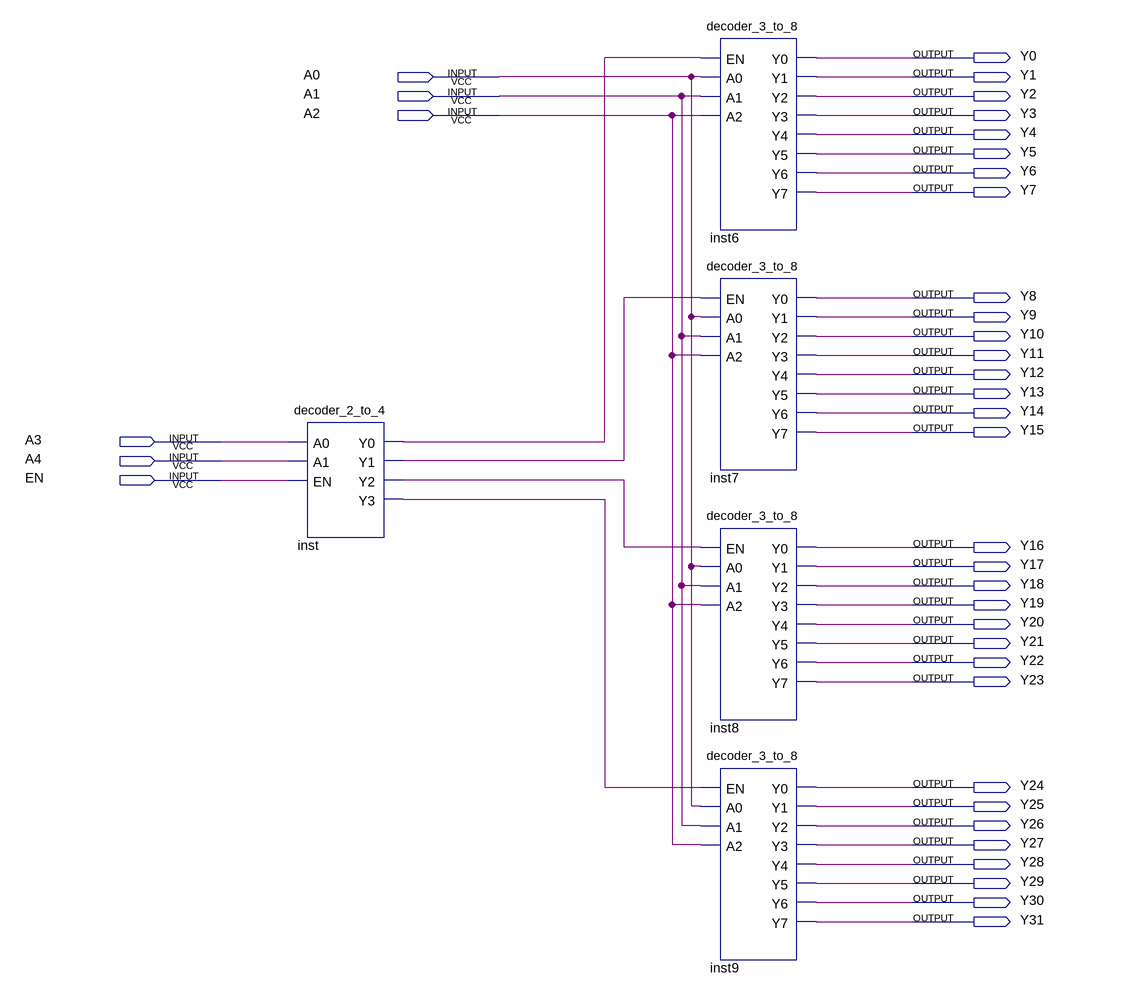
[diagram p0: schematic sheet]
// Quartus schematic decoder_5_to_32.bdf as structural Verilog: 5 symbols, 38 pins
module decoder_5_to_32 (
  input  A0,
  input  A1,
  input  A2,
  input  A3,
  input  A4,
  input  EN,
  output Y0,
  output Y1,
  output Y2,
  output Y3,
  output Y4,
  output Y5,
  output Y6,
  output Y7,
  output Y8,
  output Y9,
  output Y10,
  output Y11,
  output Y12,
  output Y13,
  output Y14,
  output Y15,
  output Y16,
  output Y17,
  output Y18,
  output Y19,
  output Y20,
  output Y21,
  output Y22,
  output Y23,
  output Y24,
  output Y25,
  output Y26,
  output Y27,
  output Y28,
  output Y29,
  output Y30,
  output Y31
);

  wire inst_y0, inst_y1, inst_y2, inst_y3;

  decoder_2_to_4 inst (.A0(A3), .A1(A4), .EN(EN), .Y0(inst_y0), .Y1(inst_y1), .Y2(inst_y2), .Y3(inst_y3));
  decoder_3_to_8 inst6 (
    .EN(inst_y0), .A0(A0), .A1(A1), .A2(A2), .Y0(Y0), .Y1(Y1), .Y2(Y2), .Y3(Y3), .Y4(Y4), .Y5(Y5), .Y6(Y6),
    .Y7(Y7));
  decoder_3_to_8 inst7 (
    .EN(inst_y1), .A0(A0), .A1(A1), .A2(A2), .Y0(Y8), .Y1(Y9), .Y2(Y10), .Y3(Y11), .Y4(Y12), .Y5(Y13),
    .Y6(Y14), .Y7(Y15));
  decoder_3_to_8 inst8 (
    .EN(inst_y2), .A0(A0), .A1(A1), .A2(A2), .Y0(Y16), .Y1(Y17), .Y2(Y18), .Y3(Y19), .Y4(Y20), .Y5(Y21),
    .Y6(Y22), .Y7(Y23));
  decoder_3_to_8 inst9 (
    .EN(inst_y3), .A0(A0), .A1(A1), .A2(A2), .Y0(Y24), .Y1(Y25), .Y2(Y26), .Y3(Y27), .Y4(Y28), .Y5(Y29),
    .Y6(Y30), .Y7(Y31));
endmodule
